# EasyEDA Pro project ProPrj_仿生鱼核心电路板_2025-10-09.epro

# Schematic 仿生鱼测试板_原理图
Board Name: 仿生鱼测试板; Create Date: 2025-10-04; Page Name: P1; Project Name: 仿生鱼核心电路板; Schematic Name: 仿生鱼测试板_原理图; Update Date: 2025-10-09; Company: 仿生鱼小组; Drawed: HaitoPhenol; Page Size: A4; Version: V1.0
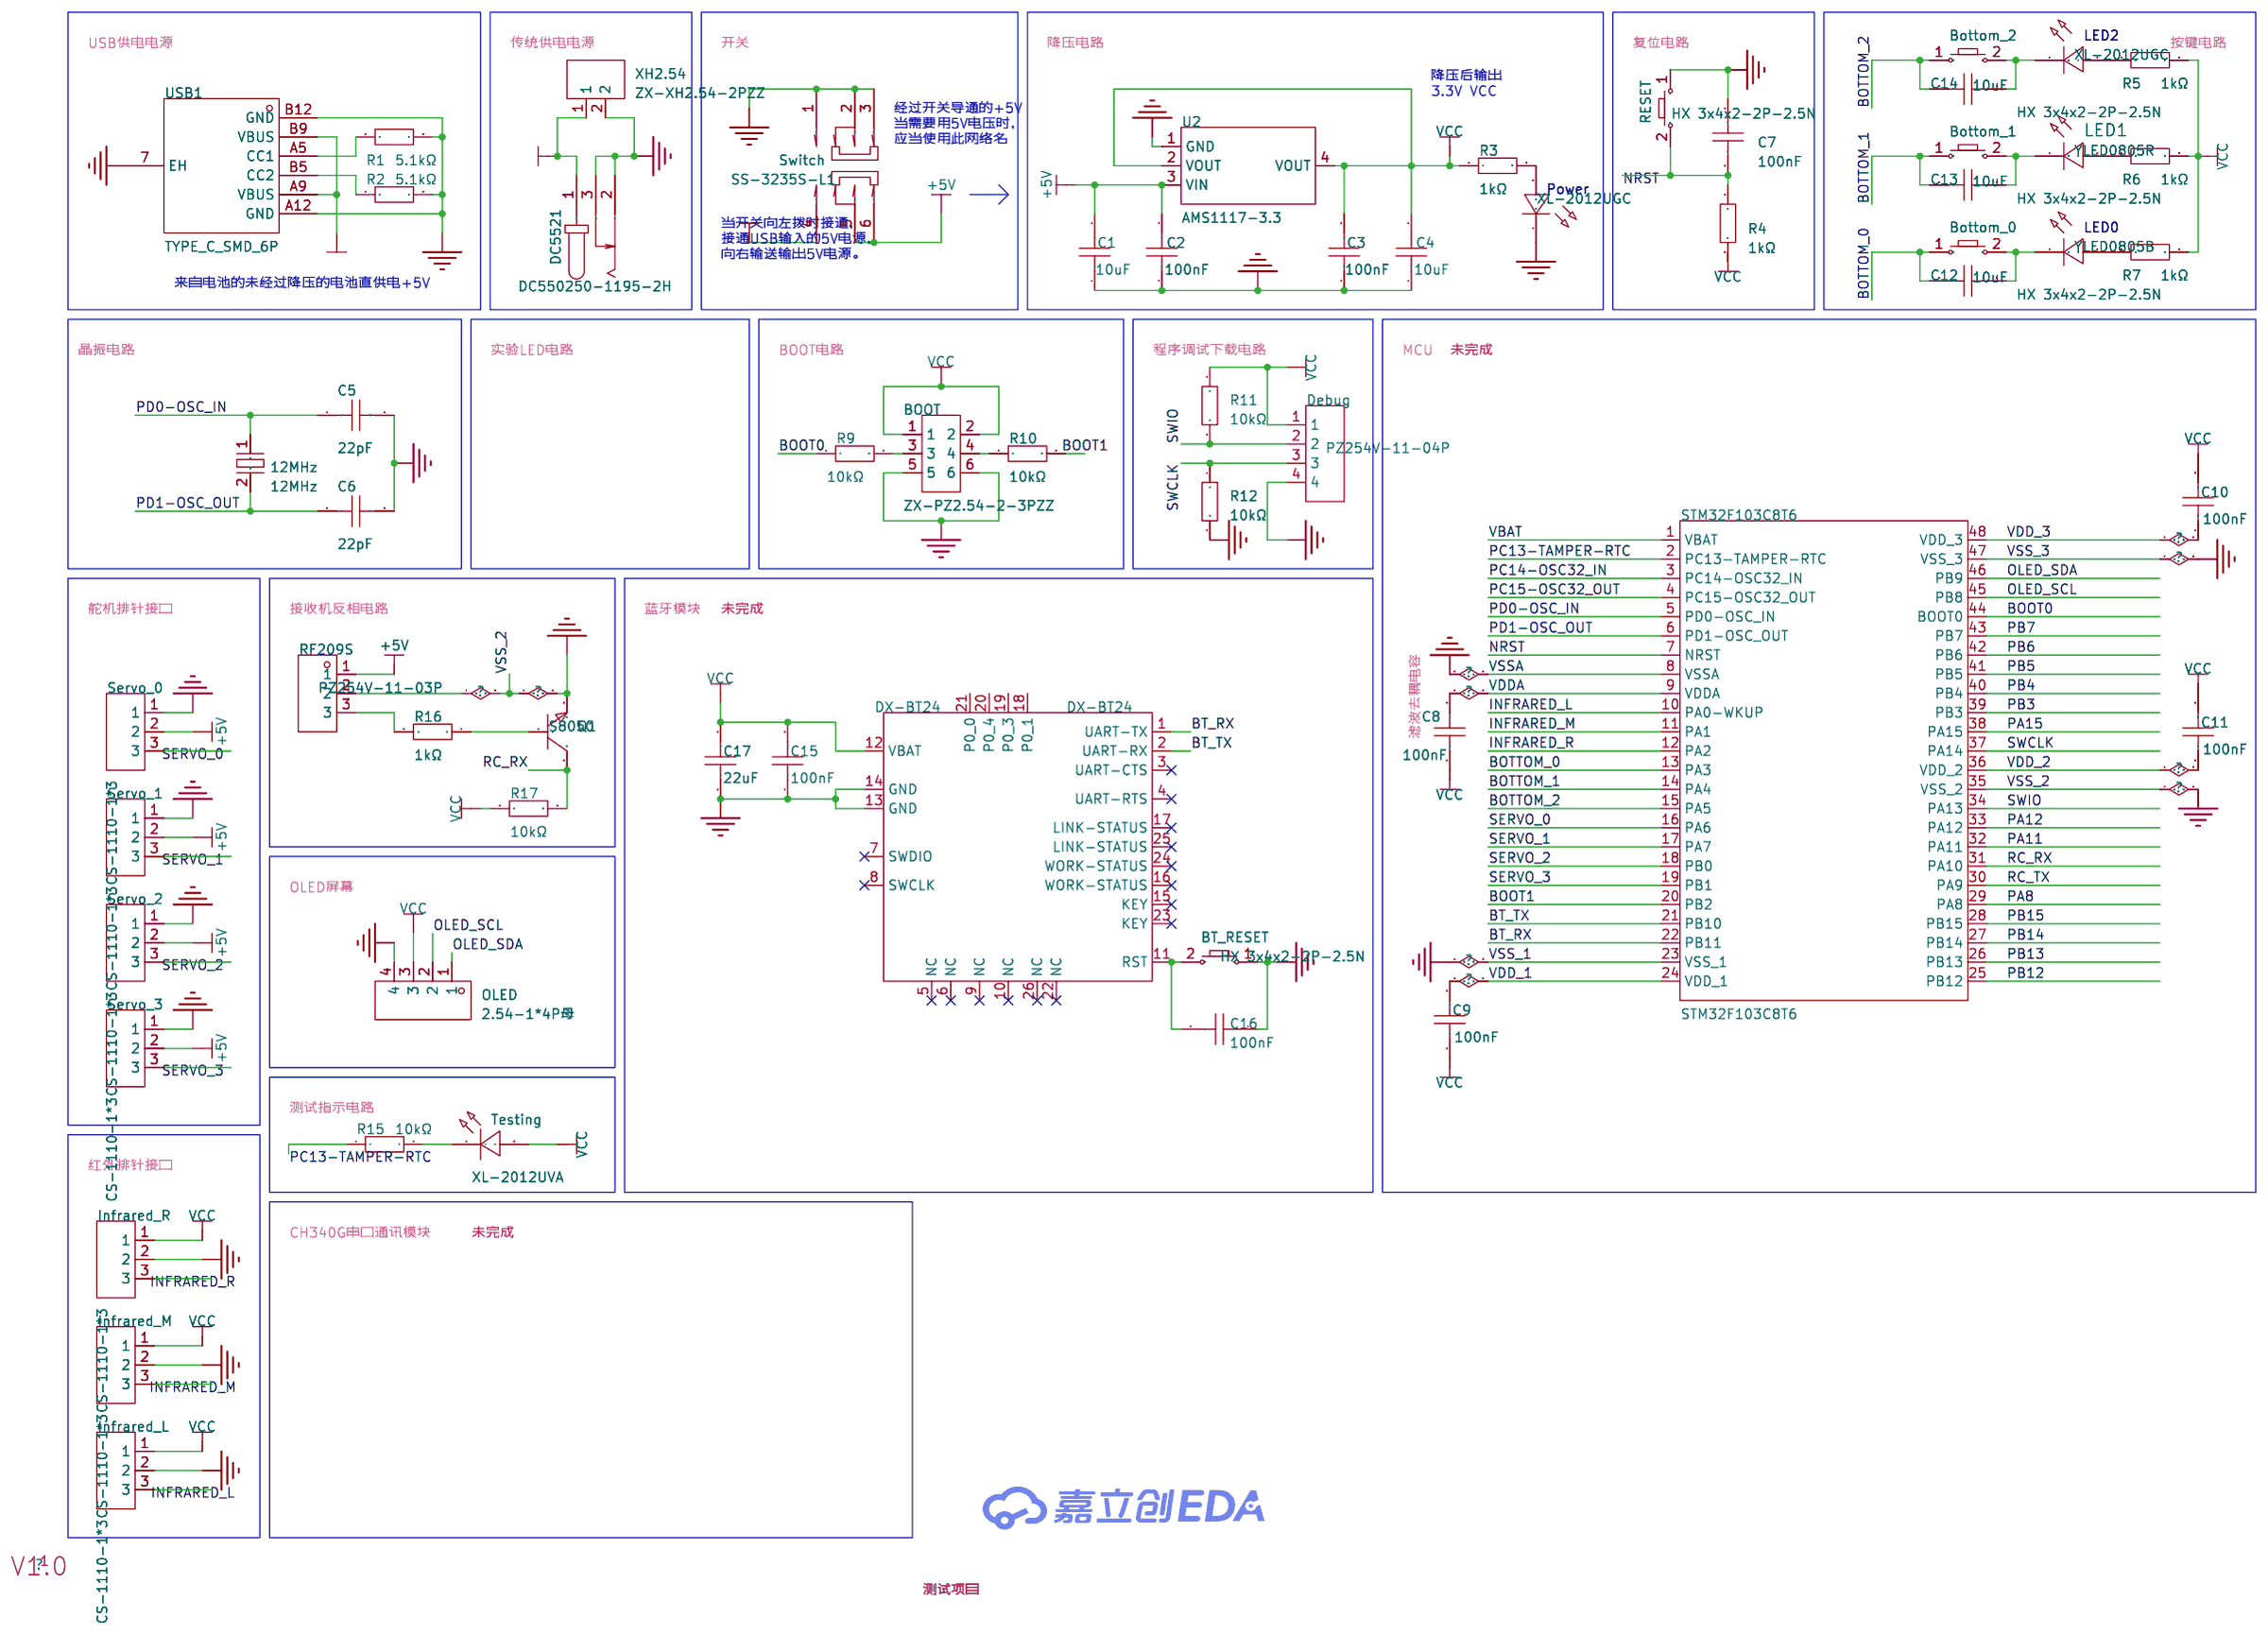
[diagram p0: schematic sheet]

## Parts
12MHz  12MHz  [CRYSTAL-SMD_L11.4-W4.7-LS12.7]
BOOT  ZX-PZ2.54-2-3PZZ  [HDR-TH_6P-P2.54-V-M-R2-C3-S2.54-1]
Bottom_0  HX 3x4x2-2P-2.5N  [SW-SMD_L4.0-W2.9-LS5.0]
Bottom_1  HX 3x4x2-2P-2.5N  [SW-SMD_L4.0-W2.9-LS5.0]
Bottom_2  HX 3x4x2-2P-2.5N  [SW-SMD_L4.0-W2.9-LS5.0]
BT_RESET  HX 3x4x2-2P-2.5N  [SW-SMD_L4.0-W2.9-LS5.0]
C1  10uF  [C0805]
C2  100nF  [C0805]
C3  100nF  [C0805]
C4  10uF  [C0805]
C5  22pF  [C0805]
C6  22pF  [C0805]
C7  100nF  [C0805]
C8  100nF  [C0805]
C9  100nF  [C0805]
C10  100nF  [C0805]
C11  100nF  [C0805]
C12  10uF  [C0805]
C13  10uF  [C0805]
C14  10uF  [C0805]
C15  100nF  [C0805]
C16  100nF  [C0805]
C17  22uF  [C0805]
DC5521  DC550250-1195-2H  [DC-IN-TH_DC550250-1195-2H-1]
Debug  PZ254V-11-04P  [HDR-TH_4P-P2.54-V-M]
DX-BT24  DX-BT24  [BULETM-SMD_26P-L26.6-W12.8-P1.50-TL]
Infrared_L  CS-1110-1*3  [HDR-TH_3P-P2.54-H-M-W6.1-N]
Infrared_M  CS-1110-1*3  [HDR-TH_3P-P2.54-H-M-W6.1-N]
Infrared_R  CS-1110-1*3  [HDR-TH_3P-P2.54-H-M-W6.1-N]
LED0  YLED0805B  [LED0805-RD]
LED1  YLED0805R  [LED0805-RD_RED]
LED2  XL-2012UGC  [LED0805-RD_GREEN]
OLED  2.54-1*4P母  [HDR-TH_4P-P2.54-V-F]
Power  XL-2012UGC  [LED0805-RD_GREEN]
Q1  S8050  [SOT-23-3_L2.9-W1.3-P1.90-LS2.4-BR]
R1  5.1kΩ  [R0805]
R2  5.1kΩ  [R0805]
R3  1kΩ  [R0805]
R4  1kΩ  [R0805]
R5  1kΩ  [R0805]
R6  1kΩ  [R0805]
R7  1kΩ  [R0805]
R9  10kΩ  [R0805]
R10  10kΩ  [R0805]
R11  10kΩ  [R0805]
R12  10kΩ  [R0805]
R15  10kΩ  [R0805]
R16  1kΩ  [R0805]
R17  10kΩ  [R0805]
RESET  HX 3x4x2-2P-2.5N  [SW-SMD_L4.0-W2.9-LS5.0]
RF209S  PZ254V-11-03P  [HDR-TH_3P-P2.54-V-M]
Servo_0  CS-1110-1*3  [HDR-TH_3P-P2.54-H-M-W6.1-N]
Servo_1  CS-1110-1*3  [HDR-TH_3P-P2.54-H-M-W6.1-N]
Servo_2  CS-1110-1*3  [HDR-TH_3P-P2.54-H-M-W6.1-N]
Servo_3  CS-1110-1*3  [HDR-TH_3P-P2.54-H-M-W6.1-N]
STM32F103C8T6  STM32F103C8T6  [LQFP-48_L7.0-W7.0-P0.50-LS9.0-BL]
Switch  SS-3235S-L1  [SW-SMD_SS-3235S-LX]
Testing  XL-2012UVA  [LED0805-RD]
U2  AMS1117-3.3  [SOT-223-3_L6.5-W3.4-P2.30-LS7.0-BR]
USB1  TYPE_C_SMD_6P  [TYPE-C-SMD_TYPE-C-6P]
XH2.54  ZX-XH2.54-2PZZ  [CONN-TH_2P-P2.50_HX25003-2A]

## Library data of the parts
12MHz = ABLS-12.000MHZ-B4H-T: 频率:12MHz;常温频差:±30ppm;外接负载电容:18pF;频率稳定度(全温):±35ppm;; LCSC Part Name: 12MHz ±30ppm 18pF; Supplier Part: C1986452; Manufacturer: ABRACON; Supplier Footprint: HC-49S-SMD; JLCPCB Part Class: 扩展库; Datasheet: https://atta.szlcsc.com/upload/public/pdf/source/20210612/96A8D0E14BE5C26ADD56CBF11909D043.pdf; Supplier: LCSC; Normal temperature Frequency Tolerance: ±30ppm; External load capacitor: 18pF; Frequency Stability(Full temperature range): ±35ppm; Equivalent Series Resistance (ESR): 50Ω; Operating Temperature: -20℃~+70℃
BOOT = ZX-PZ2.54-2-3PZZ: 插针结构:2x3P;间距:2.54mm;行距:2.54mm;圆针/方针:方针;安装方式:直插;排数:双排;总PIN位数:6P;额定电流:3A;额定电压:1kV;配合针长度:6mm;塑高:2.5mm;端接针长度:3mm;触头材质:黄铜;触头镀层:金;工作温度:-40℃~+105℃;颜色:黑色;; LCSC Part Name: 2x3P 间距:2.54mm 方针 直插; Supplier Part: C7501274; Manufacturer: Megastar(兆星); Supplier Footprint: 插件,P=2.54mm; JLCPCB Part Class: Extended Part; Datasheet: https://item.szlcsc.com/datasheet/ZX-PZ2.54-2-3PZZ/8582487.html; Supplier: LCSC; Pin Structure: 2x3P; Pitch: 2.54mm; Row Spacing: 2.54mm; Circluar Pins/Square Pins: 方针; Mounting Type: 直插; Number of Rows: 双排; Number of Pins: 6P; Current Rating: 3A; Voltage Rating (Max): 1kV; Length of Mating Pin: 6mm; Insulation Height: 2.5mm; Length of End Connection Pin: 3mm; Contact Material: 黄铜; Contact Plating: 金; Operating Temperature: -40℃~+105℃; Color: 黑色
Bottom_0-Bottom_2 BT_RESET RESET = HX 3x4x2-2P-2.5N: 电路结构:单刀单掷;按钮形状:圆形按钮;作用力:2.5N;安装方式:立贴;开关长度:4mm;开关宽度:3mm;开关高度:2mm;带支架:不带支架;触点电流:50mA;额定电压:12V;带灯:无;工作寿命:10万次;; LCSC Part Name: 4*3*2mm 立贴 轻触开关; Supplier Part: C36498961; Manufacturer: hanxia(韩下); Supplier Footprint: SMD,3x4mm; JLCPCB Part Class: Extended Part; Datasheet: https://item.szlcsc.com/datasheet/HX%25203x4x2-2P-2.5N/38220903.html; Supplier: LCSC; Circuit: 单刀单掷; Actuator Style: 圆形按钮; Operating Force: 2.5N; Mounting Type: 立贴; Length: 4mm; Width: 3mm; Switch Height: 2mm; with Bracket: 不带支架; Contact Current: 50mA; Voltage Rating: 12V; Actuator/Cap Color: 黑色; With Lamp: 无; Termination Style: SMD接片; Life: 10万次
C1 C4 C12-C14 = CL21A106KAYNNNE_C15850: 容值:10uF;精度:±10%;额定电压:25V;温度系数:X5R;; LCSC Part Name: 10uF ±10% 25V; Supplier Part: C15850; Manufacturer: SAMSUNG(三星); Manufacturer Part: CL21A106KAYNNNE; Supplier Footprint: 0805; JLCPCB Part Class: Basic Part; Datasheet: https://item.szlcsc.com/datasheet/CL21A106KAYNNNE/16532.html; Supplier: LCSC; Tolerance: ±10%; Voltage Rating: 25V; Temperature Coefficient: X5R
C2 C3 C7-C11 C15 C16 = CC0805KRX7R9BB104: 容值:100nF;精度:±10%;额定电压:50V;温度系数:X7R;; LCSC Part Name: 100nF ±10% 50V; Supplier Part: C49678; Manufacturer: YAGEO(国巨); Supplier Footprint: 0805; JLCPCB Part Class: Basic Part; Datasheet: https://item.szlcsc.com/datasheet/CC0805KRX7R9BB104/50686.html; Supplier: LCSC; Tolerance: ±10%; Voltage Rating: 50V; Temperature Coefficient: X7R
C5 C6 = CL21C220JBANNNC: 容值:22pF;精度:±5%;额定电压:50V;温度系数:C0G;; LCSC Part Name: 22pF ±5% 50V; Supplier Part: C1804; Manufacturer: SAMSUNG(三星); Supplier Footprint: 0805; JLCPCB Part Class: Basic Part; Datasheet: https://item.szlcsc.com/datasheet/CL21C220JBANNNC/2156.html; Supplier: LCSC; Tolerance: ±5%; Voltage Rating: 50V; Temperature Coefficient: C0G
C17 = CL21A226MAQNNNE: 容值:22uF;精度:±20%;额定电压:25V;温度系数:X5R;; LCSC Part Name: 22uF ±20% 25V; Supplier Part: C45783; Manufacturer: SAMSUNG(三星); Supplier Footprint: 0805; JLCPCB Part Class: Basic Part; Datasheet: https://item.szlcsc.com/datasheet/CL21A226MAQNNNE/46786.html; Supplier: LCSC; Tolerance: ±20%; Voltage Rating: 25V; Temperature Coefficient: X5R
DC5521 = DC550250-1195-2H: 连接器类型:DC电源插座;; LCSC Part Name: DC电源插座; Supplier Part: C7587688; Manufacturer: HDGC(华德共创); Supplier Footprint: SMD; JLCPCB Part Class: Extended Part; Datasheet: https://atta.szlcsc.com/upload/public/pdf/source/20230901/4445EE13BEDCD7C352A599E30C18066F.pdf; Supplier: LCSC; Connector Type: DC电源插座
Debug = PZ254V-11-04P_C492403: 插针结构:1x4P;间距:2.54mm;行距:-;圆针/方针:方针;安装方式:直插;排数:单排;总PIN位数:4P;额定电流:-;额定电压:-;配合针长度:6mm;塑高:2.5mm;端接针长度:3mm;触头材质:黄铜;触头镀层:-;工作温度:-40℃~+105℃;颜色:黑色;; LCSC Part Name: 1x4P 间距:2.54mm 方针 直插; Supplier Part: C492403; Manufacturer: XFCN(兴飞); Supplier Footprint: 插件,P=2.54mm; JLCPCB Part Class: Extended Part; Datasheet: https://atta.szlcsc.com/upload/public/pdf/source/20200309/C492403_F9F19131791D08044AD4F84F8E751A34.pdf; Supplier: LCSC; Pin Structure: 1x4P; Pitch: 2.54mm; Circluar Pins/Square Pins: 方针; Mounting Type: 直插; Number of Rows: 单排; Number of Pins: 4P; Length of Mating Pin: 6mm; Insulation Height: 2.5mm; Length of End Connection Pin: 3mm; Contact Material: 黄铜; Operating Temperature: -40℃~+105℃; Color: 黑色
DX-BT24 = DX-BT24: Supplier Part: C9900017072; Supplier Footprint: LCC-26; JLCPCB Part Class: 扩展库; Supplier: LCSC
Infrared_L Infrared_M Infrared_R Servo_0-Servo_3 = CS-1110-1*3: 插针结构:1x3P;间距:2.54mm;行距:-;圆针/方针:方针;安装方式:弯插;排数:单排;总PIN位数:3P;额定电流:3A;额定电压:250V;配合针长度:3.5mm;塑高:2.54mm;端接针长度:-;触头材质:-;工作温度:-40℃~+105℃;颜色:黑色;; LCSC Part Name: 1x3P 间距:2.54mm 方针 弯插; Supplier Part: C2886703; Manufacturer: CST(永丰盈); Supplier Footprint: 弯插,P=2.54mm; JLCPCB Part Class: Extended Part; Datasheet: https://item.szlcsc.com/datasheet/CS-1110-1*3/3101053.html; Supplier: LCSC; Pin Structure: 1x3P; Pitch: 2.54mm; Circluar Pins/Square Pins: 方针; Mounting Type: 弯插; Number of Rows: 单排; Number of Pins: 3P; Current Rating: 3A; Voltage Rating (Max): 250V; Length of Mating Pin: 3.5mm; Insulation Height: 2.54mm; Operating Temperature: -40℃~+105℃; Color: 黑色
LED0 = YLED0805B: 发光颜色:蓝色;正向电压(VF):2.7V~3.1V;功率:-;正向电流:25mA;主波长:457nm~475nm;二极管配置:-;透镜颜色:-;色温:-;发光强度:-;发光角度:-;载带方式:-;工作温度:-40℃~+85℃;; Supplier Part: C19273154; Manufacturer: YONGYUTAI(永裕泰); Supplier Footprint: 0805; JLCPCB Part Class: Extended Part; Datasheet: https://atta.szlcsc.com/upload/public/pdf/source/20231201/B2AAF083C5ADCCF8D5D977CB2CCF42BA.pdf; Supplier: LCSC; Emitted Color: 蓝色; Forward Voltage (VF): 2.7V~3.1V; Forward Current: 25mA; Dominant Wavelength: 457nm~475nm; Operating Temperature: -40℃~+85℃
LED1 = YLED0805R: 发光颜色:红色;正向电压(VF):1.8V~2.4V;功率:60mW;正向电流:20mA;主波长:615nm~630nm;二极管配置:-;透镜颜色:-;色温:-;发光强度:-;发光角度:-;载带方式:-;工作温度:-40℃~+85℃;; Supplier Part: C19171391; Manufacturer: YONGYUTAI(永裕泰); Supplier Footprint: 0805; JLCPCB Part Class: Extended Part; Datasheet: https://atta.szlcsc.com/upload/public/pdf/source/20231027/AB486D22E6D71BC59190C48A798367E6.pdf; Supplier: LCSC; Emitted Color: 红色; Forward Voltage (VF): 1.8V~2.4V; Power Dissipation: 60mW; Forward Current: 20mA; Dominant Wavelength: 615nm~630nm; Peak Wavelength: 645nm; Operating Temperature: -40℃~+85℃
LED2 Power = XL-2012UGC: 发光颜色:翠绿色;正向压降(Vf):3.2V;功率:70mW;正向电流:20mA;波长:515nm~535nm;透镜颜色:无色透明透镜;色温:-;发光强度:750mcd;发光角度:120°;载带方式:正贴;工作温度:-40℃~+85℃;; LCSC Part Name: 0805翠绿贴片式发光二极管; Supplier Part: C965815; Manufacturer: XINGLIGHT(成兴光); Supplier Footprint: 0805; JLCPCB Part Class: Extended Part; Datasheet: https://item.szlcsc.com/datasheet/XL-2012UGC/1051424.html; Supplier: LCSC; Illumination Color: 翠绿色; Voltage - Forward(Vf): 3.2V; Power(Watts): 70mW; Forward Current: 20mA; Wavelength - Dominant: 515nm~535nm; Peak Wavelength: 525nm; Lens Color: 无色透明透镜; Luminous Intensity: 750mcd; Viewing Angle: 120°; Mounting Style: 正贴; Operating Temperature: -40℃~+85℃
OLED = 2.54-1*4P母: 插孔结构:1x4P;间距:2.54mm;行距:-;圆孔/方孔:方孔;安装方式:直插;排数:单排;总孔位数:4P;额定电流:3A;额定电压:-;插孔方向:顶部;塑高:-;触头材质:青铜;触头镀层:-;工作温度:-40℃~+105℃;; LCSC Part Name: 间距:2.54mm 1x4P 直插; Supplier Part: C2718488; Manufacturer: BOOMELE(博穆精密); Supplier Footprint: 插件,P=2.54mm; JLCPCB Part Class: 扩展库; Datasheet: https://item.szlcsc.com/datasheet/2.54-1*4P%25E6%25AF%258D/2834502.html; Supplier: LCSC; Holes Structure: 1x4P; Pitch: 2.54mm; Circular Hole / Square Hole: 方孔; Mounting Type: 直插; Number of Rows: 单排; Number of Positions: 4P; Current Rating: 3A; Holes Direction: 顶部; Contact Material: 青铜; Operating Temperature: -40℃~+105℃
Q1 = S8050_C2891804: 晶体管类型:NPN;集电极电流(Ic):500mA;集射极击穿电压(Vceo):25V;耗散功率(Pd):300mW;直流电流增益(hFE):400@50mA,1V;; LCSC Part Name: NPN 电流:0.5A 电压:25V; Supplier Part: C2891804; Manufacturer: YONGYUTAI(永裕泰); Supplier Footprint: SOT-23; JLCPCB Part Class: Extended Part; Datasheet: https://item.szlcsc.com/datasheet/S8050/3119723.html; Supplier: LCSC; type: NPN; Current - Collector(Ic): 500mA; Collector - Emitter Voltage VCEO: 25V; Pd - Power Dissipation: 300mW; DC Current Gain: 400@50mA,1V; Current - Collector Cutoff: 1uA; Vce Saturation(VCE(sat)): 500mV@500mA,50mA; Emitter-Base Voltage(Vebo): 5V
R1 R2 = RT0805BRD075K1L: 电阻类型:薄膜电阻;阻值:5.1kΩ;精度:±0.1%;功率:125mW;最大工作电压:150V;温度系数:±25ppm/℃;; LCSC Part Name: 薄膜电阻 5.1kΩ ±0.1% 125mW; Supplier Part: C122968; Manufacturer: YAGEO(国巨); Supplier Footprint: 0805; JLCPCB Part Class: Extended Part; Datasheet: https://atta.szlcsc.com/upload/public/pdf/source/20170728/C122968_1501225760866848819.pdf; Supplier: LCSC; Type: 薄膜电阻; Tolerance: ±0.1%; Power(Watts): 125mW; Overload Voltage (Max): 150V; Temperature Coefficient: ±25ppm/℃; Operating Temperature Range: -55℃~+155℃
R3-R7 R16 = RT0805BRD071KL: 电阻类型:薄膜电阻;阻值:1kΩ;精度:±0.1%;功率:125mW;最大工作电压:150V;温度系数:±25ppm/℃;; LCSC Part Name: 薄膜电阻 1kΩ ±0.1% 125mW; Supplier Part: C110774; Manufacturer: YAGEO(国巨); Supplier Footprint: 0805; JLCPCB Part Class: Extended Part; Datasheet: https://atta.szlcsc.com/upload/public/pdf/source/20171026/C133380_15089840010201058857.pdf; Supplier: LCSC; Type: 薄膜电阻; Tolerance: ±0.1%; Power(Watts): 125mW; Overload Voltage (Max): 150V; Temperature Coefficient: ±25ppm/℃; Operating Temperature Range: -55℃~+155℃
R9-R12 R15 R17 = RT0805BRD0710KL: 电阻类型:薄膜电阻;阻值:10kΩ;精度:±0.1%;功率:125mW;工作电压:150V;温度系数:±25ppm/℃;; LCSC Part Name: 薄膜电阻 10kΩ ±0.1% 125mW; Supplier Part: C110775; Manufacturer: YAGEO(国巨); Supplier Footprint: 0805; JLCPCB Part Class: Extended Part; Datasheet: https://item.szlcsc.com/datasheet/RT0805BRD0710KL/112000.html; Supplier: LCSC; Type: 薄膜电阻; Tolerance: ±0.1%; Power(Watts): 125mW; Voltage-Supply(Max): 150V; Temperature Coefficient: ±25ppm/℃; Operating Temperature: -55℃~+155℃
RF209S = PZ254V-11-03P: 插针结构:1x3P;间距:2.54mm;行距:-;圆针/方针:方针;安装方式:直插;排数:单排;总PIN位数:3P;额定电流:3A;额定电压:250V;配合针长度:6mm;塑高:2.5mm;端接针长度:3mm;工作温度:-40℃~+105℃;颜色:黑色;; LCSC Part Name: 1x3P 间距:2.54mm 方针 直插; Supplier Part: C2937625; Manufacturer: XFCN(兴飞); Supplier Footprint: 插件,P=2.54mm; JLCPCB Part Class: Extended Part; Datasheet: https://item.szlcsc.com/datasheet/PZ254V-11-03P/3293280.html; Supplier: LCSC; Pin Structure: 1x3P; Pitch: 2.54mm; Circluar Pins/Square Pins: 方针; Mounting Type: 直插; Number of Rows: 单排; Number of Pins: 3P; Current Rating: 3A; Voltage Rating (Max): 250V; Length of Mating Pin: 6mm; Insulation Height: 2.5mm; Length of End Connection Pin: 3mm; Operating Temperature: -40℃~+105℃; Color: 黑色
STM32F103C8T6 = STM32F103C8T6: CPU内核:ARM-M3;CPU最大主频:72MHz;应用领域:-;; LCSC Part Name: 主流增强型ARM Cortex-M3 MCU，具有64 KB Flash、72 MHz CPU、电机控制、USB和CAN; Supplier Part: C8734; Manufacturer: ST(意法半导体); Supplier Footprint: LQFP-48(7x7); JLCPCB Part Class: 扩展库; Datasheet: https://item.szlcsc.com/datasheet/STM32F103C8T6/9243.html; Supplier: LCSC; CPU Core: ARM-M3; CPU Maximum Speed: 72MHz; Program Storage Size: 64KB; Program Memory Type: FLASH; Number of I/O: 37; ADC (Bit): 12bit; Voltage - Supply: 2V~3.6V
Switch = SS-3235S-L1: 电路结构:双刀双掷;安装方式:卧贴;开关颜色:黑色;额定电流:50mA;额定电压:12V;工作寿命:1万次;; LCSC Part Name: 柄长2mm 卧贴双档 滑动开关; Supplier Part: C500055; Manufacturer: XKB Connection(中国星坤); Supplier Footprint: SMD,9.1x3.6mm; JLCPCB Part Class: 扩展库; Datasheet: https://item.szlcsc.com/datasheet/SS-3235S-L1/512181.html; Supplier: LCSC; Circuit: 双刀双掷; Actuator Style: 矩形柱状; Termination Style: 鸥翼型; Length: 9.1mm; Width: 3.55mm; Switch Height: 3.2mm; Mounting Type: 卧贴; Actuator Color: 黑色; Current Rating: 50mA; Voltage Rating: 12V; Life: 1万次; Operating Temperature: -40℃~+85℃
Testing = XL-2012UVA: 发光颜色:紫色;正向压降(Vf):2.9V~3.5V;功率:70mW;正向电流:20mA;波长:-;透镜颜色:无色透明透镜;发光角度:120°;载带方式:正贴;工作温度:-40℃~+85℃;; LCSC Part Name: 0805紫贴片式发光二极管; Supplier Part: C7371915; Manufacturer: XINGLIGHT(成兴光); Supplier Footprint: 0805; JLCPCB Part Class: Extended Part; Datasheet: https://item.szlcsc.com/datasheet/XL-2012UVA/8342987.html; Supplier: LCSC; Illumination Color: 紫色; Voltage - Forward(Vf): 2.9V~3.5V; Power(Watts): 70mW; Forward Current: 20mA; Peak Wavelength: 405nm; Lens Color: 无色透明透镜; Viewing Angle: 120°; Mounting Style: 正贴; Operating Temperature: -40℃~+85℃
U2 = AMS1117-3.3_C6186: 输出类型:固定;工作电压:16V;输出电压:3.3V;输出电流:1A;电源纹波抑制比(PSRR):72dB@(120Hz);输出极性:正极;; LCSC Part Name: 输出3.3V 1A; Supplier Part: C6186; Manufacturer: AMS; Supplier Footprint: SOT-223; JLCPCB Part Class: 基础库; Datasheet: https://item.szlcsc.com/datasheet/AMS1117-3.3/6652.html; Supplier: LCSC; Output Type: 固定; Voltage - Supply: 16V; Output Voltage: 3.3V; Output Current: 1A; Power Supply Rejection Ratio (PSRR): 72dB@(120Hz); Voltage Dropout: 1.1V@(800mA); standby current: 5mA; Features: 过流保护；过热保护; Operating Temperature: -40℃~+125℃; Output Configuration: 正极; Number of Outputs: 1
USB1 = TYPE_C_SMD_6P: Supplier Part: C9900003080; Supplier Footprint: TYPE_C_USB_6P; JLCPCB Part Class: 扩展库; Supplier: LCSC
XH2.54 = ZX-XH2.54-2PZZ: 插针结构:1x2P;间距:2.5mm;安装方式:直插;参考系列:XH;总PIN数:2P;排数:1;每排PIN数:2;行距:-;额定电流:3A;触头材质:黄铜;触头镀层:锡;工作温度:-25℃~+85℃;; LCSC Part Name: 1x2P 间距:2.5mm 直插 系列:XH; Supplier Part: C7429632; Manufacturer: Megastar(兆星); Supplier Footprint: 插件,P=2.5mm; JLCPCB Part Class: Extended Part; Datasheet: https://item.szlcsc.com/datasheet/ZX-XH2.54-2PZZ/8427549.html; Supplier: LCSC; Pins Structure: 1x2P; Pitch: 2.5mm; Mounting Type: 直插; Reference Series: XH; Number of Pins: 2P; Number of Rows: 1; Number of PINs Per Row: 2; Current Rating: 3A; Contact Material: 黄铜; Contact Plating: 锡; Operating Temperature: -25℃~+85℃; Voltage Rating: 250V; Plastic Material: PA66; Flame Retardant Rating: UL94V-0; Color: 白色; Z-Height of the Board: 7mm; X-Length of Bottom Edge on Board (Spacing Line): 7.5mm; Y-Width of Bottom Edge on Board: 5.9mm

## Nets
+5V: C1.2 C2.2 RF209S.1 Servo_0.2 Servo_1.2 Servo_2.2 Servo_3.2 Switch.5 Switch.6 U2.3(VIN)
GND: BOOT.5 BOOT.6 BT_RESET.1 C1.1 C2.1 C3.1 C4.1 C5.2 C6.2 C7.1 C15.1 C16.1 C17.1 DC5521.2(-) DC5521.3 Debug.4 DX-BT24.13(GND) DX-BT24.14(GND) Infrared_L.2 Infrared_M.2 Infrared_R.2 OLED.4 Power.1(C) Q1.2 R1.2 R2.2 R12.2 RESET.1 RF209S.2 Servo_0.1 Servo_1.1 Servo_2.1 Servo_3.1 STM32F103C8T6.8(VSSA) STM32F103C8T6.23(VSS_1) STM32F103C8T6.35(VSS_2) STM32F103C8T6.47(VSS_3) Switch.1 Switch.2 Switch.3 U2.1(GND) USB1.7(EH) USB1.A12(GND) USB1.B12(GND) XH2.54.2
VBAT: STM32F103C8T6.1(VBAT)
VCC: BOOT.1 BOOT.2 C3.2 C4.2 C8.1 C9.1 C10.2 C11.2 C15.2 C17.2 Debug.1 DX-BT24.12(VBAT) Infrared_L.1 Infrared_M.1 Infrared_R.1 OLED.3 R3.1 R4.2 R5.2 R6.2 R7.2 R11.1 R17.1 Testing.2(+) U2.2(VOUT) U2.4(VOUT)
VDD_1: C9.2 STM32F103C8T6.24(VDD_1)
VDD_2: C11.1 STM32F103C8T6.36(VDD_2)
VDD_3: C10.1 STM32F103C8T6.48(VDD_3)
VDDA: C8.2 STM32F103C8T6.9(VDDA)
BOOT0: R9.1 STM32F103C8T6.44(BOOT0)
BOOT1: R10.2 STM32F103C8T6.20(PB2)
BOTTOM_0: Bottom_0.1 C12.1 STM32F103C8T6.13(PA3)
BOTTOM_1: Bottom_1.1 C13.1 STM32F103C8T6.14(PA4)
BOTTOM_2: Bottom_2.1 C14.1 STM32F103C8T6.15(PA5)
BT_RX: DX-BT24.1(UART-TX) STM32F103C8T6.22(PB11)
BT_TX: DX-BT24.2(UART-RX) STM32F103C8T6.21(PB10)
INFRARED_L: Infrared_L.3 STM32F103C8T6.10(PA0-WKUP)
INFRARED_M: Infrared_M.3 STM32F103C8T6.11(PA1)
INFRARED_R: Infrared_R.3 STM32F103C8T6.12(PA2)
INPUT+5V: DC5521.1(+) Switch.4 USB1.A9(VBUS) USB1.B9(VBUS) XH2.54.1
NRST: C7.2 R4.1 RESET.2 STM32F103C8T6.7(NRST)
OLED_SCL: OLED.2 STM32F103C8T6.45(PB8)
OLED_SDA: OLED.1 STM32F103C8T6.46(PB9)
PA8: STM32F103C8T6.29(PA8)
PA11: STM32F103C8T6.32(PA11)
PA12: STM32F103C8T6.33(PA12)
PA15: STM32F103C8T6.38(PA15)
PB3: STM32F103C8T6.39(PB3)
PB4: STM32F103C8T6.40(PB4)
PB5: STM32F103C8T6.41(PB5)
PB6: STM32F103C8T6.42(PB6)
PB7: STM32F103C8T6.43(PB7)
PB12: STM32F103C8T6.25(PB12)
PB13: STM32F103C8T6.26(PB13)
PB14: STM32F103C8T6.27(PB14)
PB15: STM32F103C8T6.28(PB15)
PC13-TAMPER-RTC: R15.1 STM32F103C8T6.2(PC13-TAMPER-RTC)
PC14-OSC32_IN: STM32F103C8T6.3(PC14-OSC32_IN)
PC15-OSC32_OUT: STM32F103C8T6.4(PC15-OSC32_OUT)
PD0-OSC_IN: 12MHz.1 C5.1 STM32F103C8T6.5(PD0-OSC_IN)
PD1-OSC_OUT: 12MHz.2(GND) C6.1 STM32F103C8T6.6(PD1-OSC_OUT)
RC_RX: Q1.3 R17.2 STM32F103C8T6.31(PA10)
RC_TX: STM32F103C8T6.30(PA9)
SERVO_0: Servo_0.3 STM32F103C8T6.16(PA6)
SERVO_1: Servo_1.3 STM32F103C8T6.17(PA7)
SERVO_2: Servo_2.3 STM32F103C8T6.18(PB0)
SERVO_3: Servo_3.3 STM32F103C8T6.19(PB1)
SWCLK: Debug.3 R12.1 STM32F103C8T6.37(PA14)
SWIO: Debug.2 R11.2 STM32F103C8T6.34(PA13)
$1N579: R1.1 USB1.A5(CC1)
$1N594: R2.1 USB1.B5(CC2)
$1N1186: Power.2(A) R3.2
$1N2699: Bottom_2.2 C14.2 LED2.1(C)
$1N2741: Bottom_1.2 C13.2 LED1.1(C)
$1N2780: Bottom_0.2 C12.2 LED0.1(C)
$1N2936: LED2.2(A) R5.1
$1N2962: LED1.2(A) R6.1
$1N2988: LED0.2(A) R7.1
$1N3926: R15.2 Testing.1(-)
$1N5089: R16.2 RF209S.3
$1N5316: Q1.1 R16.1
$1N6288: BT_RESET.2 C16.2 DX-BT24.11(RST)
$1N20010: BOOT.3 R9.2
$1N20015: BOOT.4 R10.1

Not connected (* = marked no-connect by the designer): DX-BT24 3(UART-CTS)* 4(UART-RTS)* 5(NC)* 6(NC)* 7(SWDIO)* 8(SWCLK)* 9(NC)* 10(NC)* 15(KEY)* 16(WORK-STATUS)* 17(LINK-STATUS)* 18(P0_1) 19(P0_3) 20(P0_4) 21(P0_0) 22(NC)* 23(KEY)* 24(WORK-STATUS)* 25(LINK-STATUS)* 26(NC)*

## Notes on the sheet
- USB供电电源
- 传统供电电源
- 开关
- 降压电路
- 复位电路
- 按键电路
- 降压后输出
  3.3V VCC
- 经过开关导通的+5V
  当需要用5V电压时，
  应当使用此网络名
- 当开关向左拨时接通，
  接通USB输入的5V电源，
  向右输送输出5V电源。
- 来自电池的未经过降压的电池直供电+5V
- 晶振电路
- 实验LED电路
- BOOT电路
- 程序调试下载电路
- MCU
- 未完成
- 舵机排针接口
- 接收机反相电路
- 蓝牙模块
- 未完成
- 滤波去耦电容
- OLED屏幕
- 测试指示电路
- 红外排针接口
- CH340G串口通讯模块
- 未完成

# Board 仿生鱼测试板_PCB
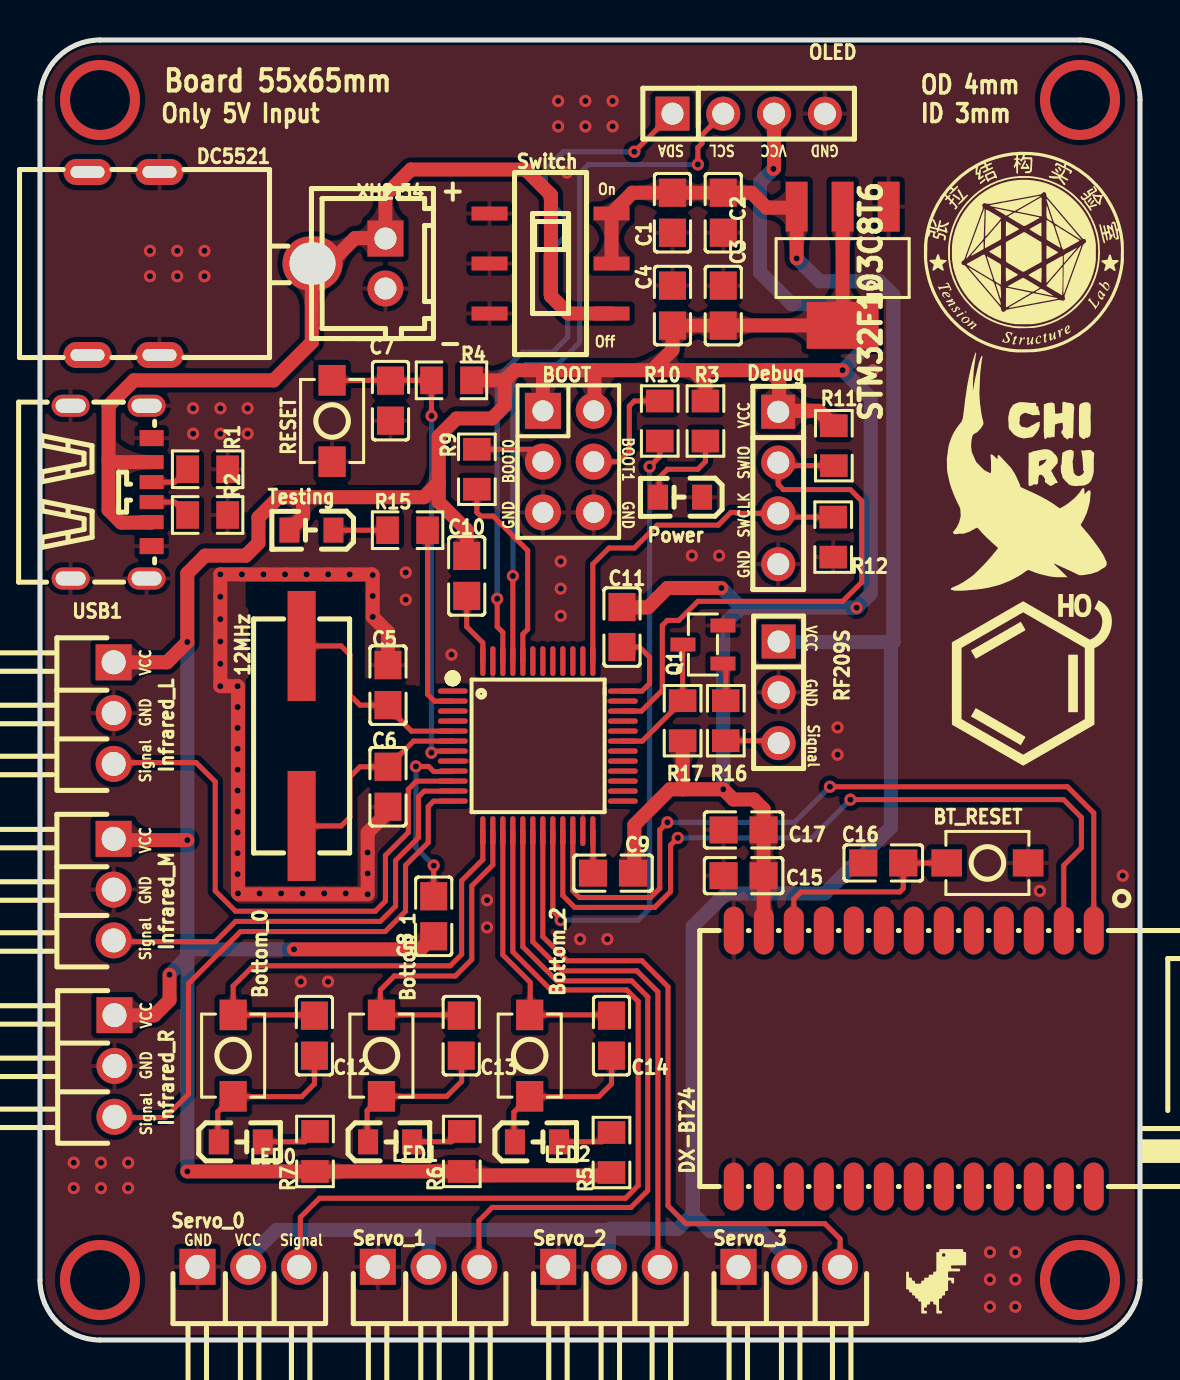
[diagram p1: board, top side]
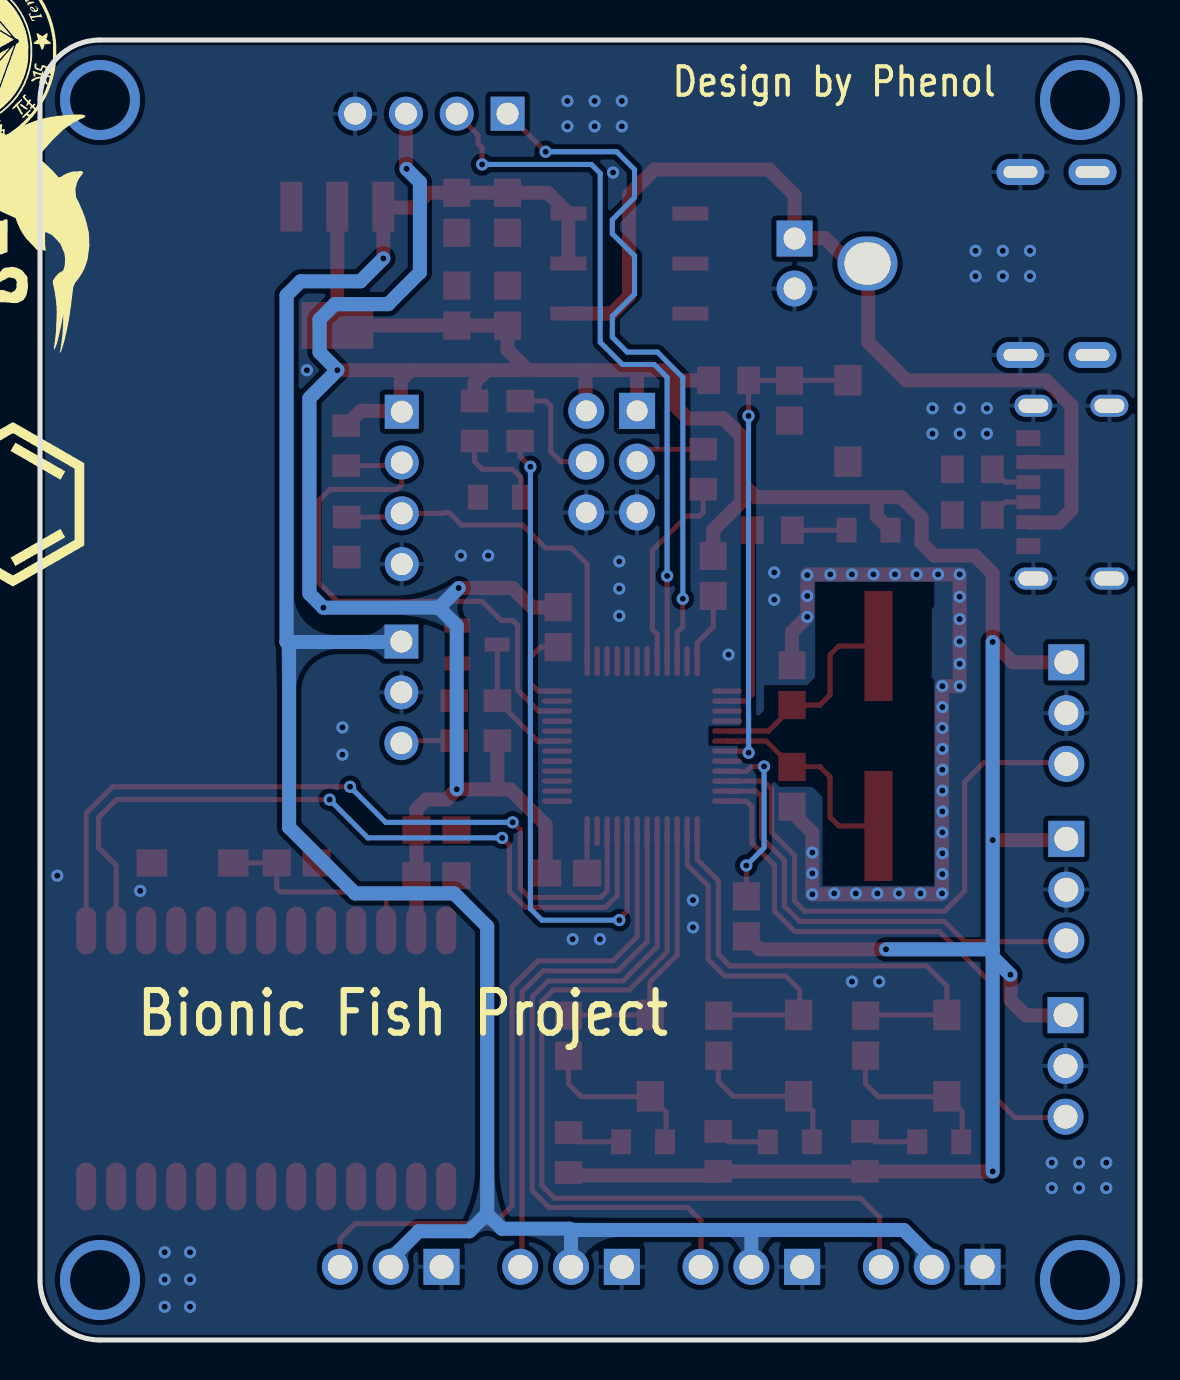
[diagram p2: board, bottom side, seen from below]

Outline 55 x 65 mm; copper layers: Top Layer, Bottom Layer. Coordinates in mm from the lower left corner of the outline.
Outline path: 0,62 0,3 arc(0.88,0.88) 3,0 52,0 arc(54.12,0.88) 55,3 55,62 arc(54.12,64.12) 52,65 3,65 arc(0.88,64.12) 0,62
Stack: Top Layer 0.035mm / Dielectric1 1.51mm FR4 er 4.5 / Bottom Layer 0.035mm

## Design rules (mm)
net PD0-OSC_IN: DP1
net PD1-OSC_OUT: DP1
net OLED_SDA: DP2
net OLED_SCL: DP2
net BT_TX: DP3
net BT_RX: DP3
template: JLCPCB Capability(Two Layers Board)
spacing copperThickness1oz (default): track to track 0.102, other pairs 0.152 to 0.3
spacing copperThickness2oz: track to track 0.203, other pairs 0.152 to 0.3
track width copperThickness1oz (default): min 0.127, default 0.254, max 2.54
track width copperThickness2oz: min 0.203, default 0.254, max 2.54
differential pair differentialPair (default): width min 0.127, default 0.254, max 2.54; gap min 0.152, default 0.152
via viaSize (default): diameter min 0.5, default 0.61, max 10; hole min 0.3, default 0.305, max 6.3

## Placement (name value [footprint] x y rotation side)
12MHz  12MHz  [CRYSTAL-SMD_L11.4-W4.7-LS12.7]  13.08 30.2 270 top
BOOT  ZX-PZ2.54-2-3PZZ  [HDR-TH_6P-P2.54-V-M-R2-C3-S2.54-1]  26.42 43.92 270 top
Bottom_0  HX 3x4x2-2P-2.5N  [SW-SMD_L4.0-W2.9-LS5.0]  9.66 14.22 270 top
Bottom_1  HX 3x4x2-2P-2.5N  [SW-SMD_L4.0-W2.9-LS5.0]  17.07 14.22 270 top
Bottom_2  HX 3x4x2-2P-2.5N  [SW-SMD_L4.0-W2.9-LS5.0]  24.49 14.22 270 top
BT_RESET  HX 3x4x2-2P-2.5N  [SW-SMD_L4.0-W2.9-LS5.0]  47.37 23.85 180 top
C1  10uF  [C0805]  31.62 56.36 90 top
C2  100nF  [C0805]  34.16 56.36 90 top
C3  100nF  [C0805]  34.16 51.72 270 top
C4  10uF  [C0805]  31.62 51.72 270 top
C5  22pF  [C0805]  17.4 32.74 90 top
C6  22pF  [C0805]  17.4 27.66 270 top
C7  100nF  [C0805]  17.53 46.97 90 top
C8  100nF  [C0805]  19.69 21.19 90 top
C9  100nF  [C0805]  28.65 23.34 180 top
C10  100nF  [C0805]  21.34 38.2 90 top
C11  100nF  [C0805]  29.1 35.65 90 top
C12  10uF  [C0805]  13.72 15.22 270 top
C13  10uF  [C0805]  21.06 15.22 270 top
C14  10uF  [C0805]  28.57 15.22 270 top
C15  100nF  [C0805]  35.18 23.22 0 top
C16  100nF  [C0805]  42.16 23.85 0 top
C17  22uF  [C0805]  35.18 25.5 0 top
DC5521  DC550250-1195-2H  [DC-IN-TH_DC550250-1195-2H-1]  8 53.82 270 top
Debug  PZ254V-11-04P  [HDR-TH_4P-P2.54-V-M]  36.91 42.6 270 top
DX-BT24  DX-BT24  [BULETM-SMD_26P-L26.6-W12.8-P1.50-TL]  43.69 14.07 270 top
Infrared_L  CS-1110-1*3  [HDR-TH_3P-P2.54-H-M-W6.1-N]  3.68 31.34 270 top
Infrared_M  CS-1110-1*3  [HDR-TH_3P-P2.54-H-M-W6.1-N]  3.68 22.52 270 top
Infrared_R  CS-1110-1*3  [HDR-TH_3P-P2.54-H-M-W6.1-N]  3.72 13.7 270 top
LED0  YLED0805B  [LED0805-RD]  10.04 9.91 0 top
LED1  YLED0805R  [LED0805-RD_RED]  17.51 9.91 0 top
LED2  XL-2012UGC  [LED0805-RD_GREEN]  24.85 9.91 0 top
OLED  2.54-1*4P母  [HDR-TH_4P-P2.54-V-F]  35.43 61.32 0 top
Power  XL-2012UGC  [LED0805-RD_GREEN]  32 42.14 180 top
Q1  S8050  [SOT-23-3_L2.9-W1.3-P1.90-LS2.4-BR]  33.15 34.77 0 top
R1  5.1kΩ  [R0805]  8.38 43.54 0 top
R2  5.1kΩ  [R0805]  8.38 41.25 0 top
R3  1kΩ  [R0805]  33.27 45.95 270 top
R4  1kΩ  [R0805]  20.57 47.98 0 top
R5  1kΩ  [R0805]  28.57 9.37 270 top
R6  1kΩ  [R0805]  21.09 9.43 270 top
R7  1kΩ  [R0805]  13.75 9.43 270 top
R9  10kΩ  [R0805]  21.84 43.54 90 top
R10  10kΩ  [R0805]  30.99 45.95 270 top
R11  10kΩ  [R0805]  39.69 44.72 270 top
R12  10kΩ  [R0805]  39.66 40.14 270 top
R15  10kΩ  [R0805]  18.38 40.49 180 top
R16  1kΩ  [R0805]  34.29 30.96 270 top
R17  10kΩ  [R0805]  32.13 30.96 90 top
RESET  HX 3x4x2-2P-2.5N  [SW-SMD_L4.0-W2.9-LS5.0]  14.6 45.95 90 top
RF209S  PZ254V-11-03P  [HDR-TH_3P-P2.54-V-M]  36.93 32.38 270 top
Servo_0  CS-1110-1*3  [HDR-TH_3P-P2.54-H-M-W6.1-N]  10.41 3.66 0 top
Servo_1  CS-1110-1*3  [HDR-TH_3P-P2.54-H-M-W6.1-N]  19.43 3.66 0 top
Servo_2  CS-1110-1*3  [HDR-TH_3P-P2.54-H-M-W6.1-N]  28.45 3.66 0 top
Servo_3  CS-1110-1*3  [HDR-TH_3P-P2.54-H-M-W6.1-N]  37.47 3.66 0 top
STM32F103C8T6  STM32F103C8T6  [LQFP-48_L7.0-W7.0-P0.50-LS9.0-BL]  24.89 29.69 270 top
Switch  SS-3235S-L1  [SW-SMD_SS-3235S-LX]  25.53 53.82 90 top
Testing  XL-2012UVA  [LED0805-RD]  13.57 40.49 180 top
U2  AMS1117-3.3  [SOT-223-3_L6.5-W3.4-P2.30-LS7.0-BR]  40.13 53.7 90 top
USB1  TYPE_C_SMD_6P  [TYPE-C-SMD_TYPE-C-6P]  3.56 42.39 270 top
XH2.54  ZX-XH2.54-2PZZ  [CONN-TH_2P-P2.50_HX25003-2A]  17.27 53.82 270 top

## Footprints (pads in the part's own frame, mm; a bottom-side part is the same pattern mirrored in y, then rotated)
BULETM-SMD_26P-L26.6-W12.8-P1.50-TL
  oval 2.4x1 smd: 1(-6.4,9) 2(-6.4,7.5) 3(-6.4,6) 4(-6.4,4.5) 5(-6.4,3) 6(-6.4,1.5) 7(-6.4,0) 8(-6.4,-1.5) 9(-6.4,-3) 10(-6.4,-4.5) 11(-6.4,-6) 12(-6.4,-7.5) 13(-6.4,-9) 14(6.4,-9) 15(6.4,-7.5) 16(6.4,-6) 17(6.4,-4.5) 18(6.4,-3) 19(6.4,-1.5) 20(6.4,0) 21(6.4,1.5) 22(6.4,3) 23(6.4,4.5) 24(6.4,6) 25(6.4,7.5) 26(6.4,9)
C0805
  rect 1.41x1.35 smd: 1(-1,0) 2(1,0)
CONN-TH_2P-P2.50_HX25003-2A
  rect 1.8x1.8 hole 1.1: 1(-1.25,0)
  round 1.8 hole 1.1: 2(1.25,0)
CRYSTAL-SMD_L11.4-W4.7-LS12.7
  rect 5.5x1.4 smd: 1(-4.5,0) 2(4.5,0)
DC-IN-TH_DC550250-1195-2H-1
  oval 2.7x3 hole 2.1x2.3: 1(0,5.625)
  oval 1.3x2.4 hole 0.6x1.7: 2(-4.575,-2.025) 3(4.575,-2.025) 4(-4.575,-5.625) 5(4.575,-5.625)
HDR-TH_3P-P2.54-H-M-W6.1-N
  rect 1.8x1.8 hole 1.2: 1(-2.54,0)
  round 1.8 hole 1.2: 2(0,0) 3(2.54,0)
HDR-TH_3P-P2.54-V-M
  rect 1.7x1.7 hole 1.1: 1(-2.54,0)
  round 1.7 hole 1.1: 2(0,0) 3(2.54,0)
HDR-TH_4P-P2.54-V-F
  rect 1.7x1.7 hole 1.1: 1(-3.81,0)
  round 1.7 hole 1.1: 2(-1.27,0) 3(1.27,0) 4(3.81,0)
HDR-TH_4P-P2.54-V-M
  rect 1.7x1.7 hole 1.1: 1(-3.81,0)
  round 1.7 hole 1.1: 2(-1.27,0) 3(1.27,0) 4(3.81,0)
HDR-TH_6P-P2.54-V-M-R2-C3-S2.54-1
  rect 1.8x1.8 hole 1.05: 1(-2.54,-1.27)
  round 1.8 hole 1.05: 2(-2.54,1.27) 3(0,-1.27) 4(0,1.27) 5(2.54,-1.27) 6(2.54,1.27)
LED0805-RD
  rect 1x1.25 smd: 1(-1.1,0) 2(1.1,0)
LED0805-RD_GREEN
  rect 1x1.25 smd: 1(-1.1,0) 2(1.1,0)
LED0805-RD_RED
  rect 1x1.25 smd: 1(-1.1,0) 2(1.1,0)
LQFP-48_L7.0-W7.0-P0.50-LS9.0-BL
  oval 0.27x1.5 smd: 1(-2.75,-4.25) 2(-2.25,-4.25) 3(-1.75,-4.25) 4(-1.25,-4.25) 5(-0.75,-4.25) 6(-0.25,-4.25) 7(0.25,-4.25) 8(0.75,-4.25) 9(1.25,-4.25) 10(1.75,-4.25) 11(2.25,-4.25) 12(2.75,-4.25) 25(2.75,4.25) 26(2.25,4.25) 27(1.75,4.25) 28(1.25,4.25) 29(0.75,4.25) 30(0.25,4.25) 31(-0.25,4.25) 32(-0.75,4.25) 33(-1.25,4.25) 34(-1.75,4.25) 35(-2.25,4.25) 36(-2.75,4.25)
  oval 1.5x0.27 smd: 13(4.25,-2.75) 14(4.25,-2.25) 15(4.25,-1.75) 16(4.25,-1.25) 17(4.25,-0.75) 18(4.25,-0.25) 19(4.25,0.25) 20(4.25,0.75) 21(4.25,1.25) 22(4.25,1.75) 23(4.25,2.25) 24(4.25,2.75) 37(-4.25,2.75) 38(-4.25,2.25) 39(-4.25,1.75) 40(-4.25,1.25) 41(-4.25,0.75) 42(-4.25,0.25) 43(-4.25,-0.25) 44(-4.25,-0.75) 45(-4.25,-1.25) 46(-4.25,-1.75) 47(-4.25,-2.25) 48(-4.25,-2.75)
R0805
  rect 1.133x1.377 smd: 1(-1,0) 2(1,0)
SOT-23-3_L2.9-W1.3-P1.90-LS2.4-BR
  rect 1.25x0.7 smd: 1(1,-0.95) 2(1,0.95) 3(-1,0)
SOT-223-3_L6.5-W3.4-P2.30-LS7.0-BR
  rect 2.5x1.1 smd: 1(2.97,-2.3) 2(2.97,0) 3(2.97,2.3)
  rect 2.34x3.6 smd: 4(-2.97,0)
SW-SMD_L4.0-W2.9-LS5.0
  rect 1.53x1.36 smd: 1(-2.035,0) 2(2.035,0)
SW-SMD_SS-3235S-LX
  rect 0.7x1.8 smd: 1(-2.5,3.05) 2(0,3.05) 3(2.5,3.05) 4(-2.5,-3.05) 5(0,-3.05) 6(2.5,-3.05)
TYPE-C-SMD_TYPE-C-6P
  oval 1.1x1.9 hole 0.7x1.5: 7(-4.32,1.775) 7(-4.32,-2.025) 7(4.32,1.775) 7(4.32,-2.025)
  rect 0.7x1.2 smd: A5(-0.5,2.025) A9(1.5,2.025) B5(0.5,2.025) B9(-1.5,2.025)
  rect 0.8x1.2 smd: A12(2.7,2.025) B12(-2.7,2.025)

## Nets
As in the schematic.

Pads without a net: DC5521 4 5; DX-BT24 3 4 5 6 7 8 9 10 15 16 17 18 19 20 21 22 23 24 25 26

## Via types
v1: diameter 4, hole 3, Top Layer to Bottom Layer, 4 vias
v2: diameter 0.61, hole 0.305, Top Layer to Bottom Layer, 109 vias

## Routing (per net, layer and track width the routed paths; a pad name or vN(x,y) marks a point on that pad's centre or on a via; arc(x,y) is an arc through that point)
+5V: length 112.9
  Top Layer w0.701: Switch.5 Switch.6 29.62,57.36 C1.2 C2.2 35.58,57.36 36.32,56.62 37.78,56.62 U2.3 v2(37.83,54.08)
  Bottom Layer w0.701: RF209S.1 36.95,34.9 42.66,34.9 ; 32.64,6.3 32.64,20.68 34.29,22.33 39.24,22.33 42.54,25.63 42.54,34.78 42.66,34.9 ; 32.64,6.3 31.9,5.56 28.53,5.56 28.45,5.48 ; 32.64,6.3 32.65,6.31 33.53,5.44 36.07,5.44 37.34,4.17 37.34,3.79 Servo_3.2 ; 42.66,34.9 42.67,34.91 42.67,52.23 41.97,52.94 38.97,52.94 v2(37.83,54.08) ; Servo_1.2 19.43,5.5 19.43,5.5 ; 28.45,5.48 28.43,5.5 19.43,5.5 ; 28.45,5.48 Servo_2.2 ; 19.43,5.5 11.81,5.5 10.41,4.1 Servo_0.2
GND: length 40.6
  Top Layer w0.701: C5.2 17.4,35.39 v2(16.64,36.16) v2(16.64,37.2) v2(16.64,38.25) 16.6,38.28 v2(15.49,38.28) v2(14.41,38.28) v2(13.33,38.28) v2(12.25,38.28) v2(11.17,38.28) v2(10.09,38.28) v2(9.02,38.28) v2(9.02,37.16) v2(9.02,36.05) v2(9.02,34.93) v2(9.02,33.81) v2(9.02,32.69) v2(9.88,32.69) 9.9,32.67 v2(9.9,22.33) 9.94,22.29 v2(16.38,22.29) v2(16.38,23.33) v2(16.38,24.37) 16.38,25.38 17.4,26.39 C6.2
  vias: v2(1.69,8.87) v2(1.69,7.6) v2(3.05,8.87) v2(3.05,7.6) v2(4.41,8.87) v2(4.41,7.6) v2(5.5,54.46) v2(5.5,53.19) v2(6.86,54.46) v2(6.86,53.19) v2(7.66,46.58) v2(7.66,45.31) v2(8.22,54.46) v2(8.22,53.19) v2(9.02,46.58) v2(9.02,45.31) v2(9.88,31.65) v2(9.88,30.6) v2(9.88,29.56) v2(9.88,28.51) v2(9.88,27.47) v2(9.88,26.43) v2(9.88,25.38) v2(9.88,24.34) v2(9.88,23.29) v2(10.38,46.58) v2(10.38,45.31) v2(10.98,22.33) v2(12.05,22.33) v2(13.04,17.92) v2(13.13,22.33) v2(14.21,22.33) v2(14.4,17.92) v2(15.29,22.33) v2(18.29,38.38) v2(18.29,37.01) v2(20.57,34.27) v2(22.35,21.99) v2(22.35,20.63) v2(25.91,61.95) v2(25.91,60.68) v2(26.03,38.93) v2(26.03,37.57) v2(26.03,36.21) v2(26.35,58.37) v2(27,20.04) v2(27.27,61.95) v2(27.27,60.68) v2(28.37,20.04) v2(28.63,61.95) v2(28.63,60.68) v2(32.59,39.22) v2(33.96,39.22) v2(39.88,30.63) v2(39.88,29.27) v2(41.66,48.49) v2(47.5,4.39) v2(47.5,3.02) v2(47.5,1.66) v2(48.77,4.39) v2(48.77,3.02) v2(48.77,1.66) v2(49.99,22.45) v2(54.14,23.22)
VCC: length 223.2
  Top Layer w0.701: Infrared_L.1 6.35,33.89 v2(7.37,34.9) 7.37,38.33 8.25,39.22 10.29,39.22 10.92,39.85 10.92,41.12 11.94,42.14 13.15,42.14 ; Testing.2 13.15,41.17 13.15,42.14 ; R5.2 28.43,8.23 21.29,8.23 R6.2 R7.2 v2(7.37,8.43) ; v2(36.67,58.55) 36.7,58.59 OLED.3 ; 36.96,46.46 38.95,46.46 R11.1 ; 36.96,46.46 Debug.1 ; 36.96,46.46 36.96,47.98 36.45,48.49 ; 23.24,47.98 23.75,48.49 25.12,48.49 ; 23.24,47.98 23.24,46.71 22.61,46.08 20.83,46.08 19.94,45.19 19.94,42.88 ; 23.24,47.98 R4.2 ; R3.1 33.27,47.86 32.64,48.49 ; 32.14,27.53 32.13,27.54 R17.1 ; 32.14,27.53 v2(34.16,27.53) 34.67,27.03 35.69,27.03 36.18,26.53 36.18,25.51 C17.2 C15.2 36.18,20.48 DX-BT24.12 ; 32.14,27.53 31.5,27.53 29.72,25.76 29.72,23.41 C9.1 ; 25.12,48.49 25.15,48.47 BOOT.1 ; 25.12,48.49 27.72,48.49 ; 36.45,48.49 32.64,48.49 ; 36.45,48.49 v2(40.13,48.49) ; C8.1 19.03,19.53 v2(12.7,19.53) ; 32.64,48.49 30.61,48.49 ; 32.13,50.72 C3.2 34.17,50.73 U2.4 U2.2 ; Infrared_R.1 3.73,16.23 5.72,16.23 6.48,16.99 v2(6.48,18.26) ; 13.15,42.14 19.2,42.14 19.94,42.88 ; 30.61,48.49 27.72,48.49 ; 30.61,48.49 31.62,49.51 C4.2 ; 27.72,48.49 27.72,46.5 BOOT.2 ; 19.94,42.88 19.94,41.9 21.34,40.5 C10.2 ; C11.2 29.11,36.63 30.4,36.63 31.37,37.6 v2(34.07,37.6) ; v2(7.37,25) 3.75,25 Infrared_M.1
  Bottom Layer w0.701: 7.37,19.15 v2(7.37,8.43) ; 7.37,19.15 7.37,19.53 ; 7.37,19.15 v2(6.48,18.26) ; v2(36.67,58.55) 36,57.89 36,53.38 37.59,51.79 40.26,51.79 41.02,51.03 41.02,49.38 v2(40.13,48.49) 41.53,47.09 41.53,37.31 v2(40.83,36.62) 35.05,36.62 ; v2(34.16,27.53) 34.16,35.73 35.05,36.62 ; 35.05,36.62 v2(34.07,37.6) ; v2(7.37,34.9) v2(7.37,25) 7.37,19.53 ; 7.37,19.53 v2(12.7,19.53)
VDD_1: length 2.1
  Top Layer w0.254: STM32F103C8T6.24 27.65,25.44 C9.2
VDD_2: length 4.4
  Top Layer w0.254: C11.1 29.97,34.65 30.48,34.14 30.48,32.83 30.1,32.44 STM32F103C8T6.36
VDD_3: length 3.1
  Top Layer w0.254: 21.34,36.69 21.34,35.66 22.14,34.86 STM32F103C8T6.48
VDDA: length 8.8
  Top Layer w0.254: C8.2 v2(19.69,23.72) ; STM32F103C8T6.9 20.62,28.42 19.69,28.42 19.43,28.68 v2(18.8,28.68)
  Bottom Layer w0.254: v2(18.8,28.68) 18.8,24.61 v2(19.69,23.72)
(no net):
  vias: v1(3,62) v1(3,3) v1(52,62) v1(52,3)
BOOT0: length 10.1
  Top Layer w0.254: R9.1 21.84,41.38 22.02,41.2 22.66,41.2 24.38,39.47 24.38,35.54 24.14,35.29 STM32F103C8T6.44
BOOT1: length 32.9
  Top Layer w0.254: v2(26.03,20.99) 26.03,21.06 25.64,21.45 STM32F103C8T6.20 ; v2(30.48,43.66) 30.99,44.17 R10.2
  Bottom Layer w0.254: v2(26.03,20.99) 29.91,20.99 30.48,21.57 v2(30.48,43.66)
BOTTOM_0: length 24.2
  Top Layer w0.254: C12.1 13.68,16.25 Bottom_0.1 9.66,17.7 10.67,18.71 20.51,18.71 21.08,19.28 21.08,22.96 22.14,24.02 STM32F103C8T6.13
BOTTOM_1: length 17.3
  Top Layer w0.254: STM32F103C8T6.14 22.64,23.76 21.59,22.71 21.59,19.03 20.76,18.2 17.72,18.2 17.02,17.5 17.02,16.31 Bottom_1.1 21.02,16.25 C13.1
BOTTOM_2: length 13.9
  Top Layer w0.254: STM32F103C8T6.15 23.14,19.25 24.51,17.88 24.51,16.28 Bottom_2.1 28.54,16.25 C14.1
BT_RX: length 39.6
  Top Layer w0.254: v2(31.37,25.88) 30.99,25.5 30.99,22.58 30.53,22.12 26.97,22.12 26.64,22.45 STM32F103C8T6.22 ; DX-BT24.1 52.69,26.35 51.37,27.66 v2(39.5,27.66)
  Bottom Layer w0.254: v2(39.5,27.66) 37.72,25.88 v2(31.37,25.88)
BT_TX: length 39.4
  Top Layer w0.254: DX-BT24.2 51.19,23.73 52.07,24.61 52.07,26.13 51.18,27.02 v2(40.52,27.02) ; v2(31.89,25.11) 31.53,24.74 31.53,22.42 30.73,21.63 26.73,21.63 26.14,22.22 STM32F103C8T6.21
  Bottom Layer w0.254: v2(31.89,25.11) 38.61,25.11 v2(40.52,27.02)
INFRARED_L: length 28.6
  Top Layer w0.254: Infrared_L.3 3.75,28.87 7.81,28.87 8.76,27.92 8.76,22.45 9.78,21.44 16.76,21.44 17.27,21.95 17.27,24.23 18.41,25.38 18.41,27.53 18.82,27.94 STM32F103C8T6.10
INFRARED_M: length 22.6
  Top Layer w0.254: STM32F103C8T6.11 19.21,27.44 18.92,27.15 18.92,25.12 17.78,23.98 17.78,21.69 17.02,20.93 9.78,20.93 8.76,19.92 3.75,19.92 Infrared_M.3
INFRARED_R: length 29.1
  Top Layer w0.254: Infrared_R.3 3.76,11.12 6.25,11.12 7.43,12.3 7.43,17.82 10.03,20.42 17.26,20.42 18.28,21.44 18.28,23.74 19.41,24.87 19.41,26.67 19.69,26.94 STM32F103C8T6.12
INPUT+5V: length 49.4
  Top Layer w0.701: USB1.B9 3.51,43.89 3.43,43.98 ; 3.43,43.98 3.43,41.5 4.06,40.87 5.56,40.87 USB1.A9 ; 3.43,43.98 3.43,46.71 4.7,47.98 11.68,47.98 13.59,49.89 13.59,53.82 14.48,53.82 15.75,55.09 17.27,55.09 17.27,57.25 18.54,58.52 24.28,58.52 25.55,57.25 25.55,52.19 26.42,51.32 Switch.4
NRST: length 24.7
  Top Layer w0.254: v2(19.57,46.2) R4.1 17.54,47.98 C7.2 17.51,47.98 RESET.2 ; STM32F103C8T6.7 19.65,29.44 v2(19.57,29.36)
  Bottom Layer w0.254: v2(19.57,29.36) 19.57,31.23 19.57,31.23 v2(19.57,46.2)
OLED_SCL: length 35.9
  Top Layer w0.254: 34.16,61.32 33.1,60.25 33.1,59.83 32.89,59.62 v2(32.89,58.78) ; STM32F103C8T6.45 23.64,37.93 23.64,37.93 v2(23.64,38.2)
  Bottom Layer w0.254: v2(23.64,38.2) 23.64,48.13 24.29,48.78 25.88,48.78 26.99,49.89 26.99,58.33 27.43,58.78 v2(32.89,58.78)
OLED_SDA: length 35.9
  Top Layer w0.254: v2(22.86,37.06) 22.86,35.66 23.14,35.38 STM32F103C8T6.46 ; OLED.1 v2(29.72,59.41)
  Bottom Layer w0.254: v2(29.72,59.41) 26.16,59.41 25.27,58.52 25.27,57.13 26.38,56.01 26.38,55.32 25.27,54.2 25.27,52.3 26.38,51.19 26.38,50.14 25.64,49.39 24.13,49.39 22.86,48.12 v2(22.86,37.06)
PC13-TAMPER-RTC: length 9.6
  Top Layer w0.254: R15.1 19.38,32.28 19.72,31.94 STM32F103C8T6.2
PD0-OSC_IN: length 10.6
  Top Layer w0.254: STM32F103C8T6.5 18.57,30.44 17.4,31.61 C5.1 16,31.74 15.49,32.25 15.49,34.27 15.06,34.7 12MHz.1
PD1-OSC_OUT: length 10.5
  Top Layer w0.254: 12MHz.2 15.06,25.7 15.49,26.14 15.49,28.15 16,28.66 C6.1 18.69,29.95 20.64,29.95 STM32F103C8T6.6
RC_RX: length 6.8
  Top Layer w0.254: STM32F103C8T6.31 30.11,29.94 R17.2 32.13,34.77 32,34.9
SERVO_0: length 42.6
  Top Layer w0.254: STM32F103C8T6.16 23.64,19.41 25.55,17.5 29.34,17.5 29.91,16.93 29.91,7.72 29.27,7.09 13.97,7.09 13.02,6.14 13.02,3.72 Servo_0.3
SERVO_1: length 34.1
  Top Layer w0.254: STM32F103C8T6.17 24.14,19.66 25.85,17.95 29.59,17.95 30.39,17.16 30.39,7.47 29.54,6.63 22.61,6.63 21.95,5.97 21.95,3.68 Servo_1.3
SERVO_2: length 26.6
  Top Layer w0.254: Servo_2.3 30.89,3.75 30.89,17.41 29.84,18.46 26.1,18.46 24.64,19.92 STM32F103C8T6.18
SERVO_3: length 34.2
  Top Layer w0.254: Servo_3.3 40,5.06 39.24,5.82 32.29,5.82 31.4,6.71 31.4,17.66 30.1,18.96 26.35,18.96 25.14,20.17 STM32F103C8T6.19
SWCLK: length 18
  Top Layer w0.254: STM32F103C8T6.37 27.64,38.79 28.45,39.6 29.72,39.6 30.86,40.74 33.91,40.74 34.54,41.38 34.8,41.38 34.84,41.33 Debug.3 37.1,41.14 R12.1
SWIO: length 29
  Top Layer w0.254: R11.2 37.07,43.72 Debug.2 36.91,42.78 37.17,42.52 40.51,42.52 41.08,41.95 41.08,37.89 40.13,36.93 32.89,36.93 31.94,35.98 31.37,35.98 31.12,35.73 31.12,32.49 30.07,31.44 STM32F103C8T6.34
$1N579: length 2.1
  Top Layer w0.254: USB1.A5 6.74,42.89 R1.1
$1N594: length 2.1
  Top Layer w0.254: USB1.B5 6.74,41.89 R2.1
$1N1186: length 4.7
  Top Layer w0.254: R3.2 33.27,43.92 32.89,43.54 31.37,43.54 30.95,43.12 30.95,42.14
$1N2699: length 8.4
  Top Layer w0.254: C14.2 28.57,12.8 27.94,12.17 24.5,12.17 Bottom_2.2 23.7,11.4 23.7,9.91
$1N2741: length 8.2
  Top Layer w0.254: 16.36,9.91 16.36,11.47 Bottom_1.2 20.34,12.19 21.08,12.93 21.08,14.2 C13.2
$1N2780: length 8.3
  Top Layer w0.254: C12.2 13.72,12.8 13.08,12.17 9.68,12.17 Bottom_0.2 8.89,11.42 8.89,9.91
$1N2936: length 2.9
  Top Layer w0.254: R5.1 28.11,9.91 25.9,9.91
$1N2962: length 2.7
  Top Layer w0.254: 18.56,9.91 20.57,9.91 R6.1
$1N2988: length 2.9
  Top Layer w0.254: R7.1 13.23,9.91 11.09,9.91
$1N3926: length 2.7
  Top Layer w0.254: Testing.1 14.68,40.49 R15.2
$1N5089: length 2.7
  Top Layer w0.254: R16.2 36.81,29.96 RF209S.3
$1N5316: length 2
  Top Layer w0.254: 34.3,33.95 34.3,31.97 R16.1
$1N6288: length 10.7
  Top Layer w0.254: DX-BT24.11 37.69,22.04 38.05,22.4 42.98,22.4 43.16,22.58 C16.2 BT_RESET.2
$1N20010: length 3.6
  Top Layer w0.254: BOOT.3 24.53,44.54 R9.2
$1N20015: length 5.9
  Top Layer w0.254: R10.1 29.72,46.95 29.46,46.7 29.46,44.43 28.96,43.92 BOOT.4

## Copper pours and planes (outline as drawn; the poured copper is in the pictures)
GND on Top Layer: -1.52,66.52 55.75,66.52 55.75,-1.04 -1.52,-1.04
GND on Bottom Layer: -2.79,67.79 57.53,67.79 57.53,-1.04 -2.79,-1.04

Small or netless copper shapes (teardrops, artwork), in the pictures only: 158 on Top Layer, 21 on Bottom Layer

## Text on the board
Bottom Silkscreen Layer: Design by Phenol | Bionic Fish Project
Top Silkscreen Layer: Off | On | SDA | SCL | VCC | GND | Signal | SWIO | SWCLK | BOOT1 | BOOT0 | Only 5V Input | OD 4mm / ID 3mm | Board 55x65mm | - | +
